# Altium schematic sheet TuringSMD.SchDoc
size A2; SheetNumber: 1; SheetTotal: 3
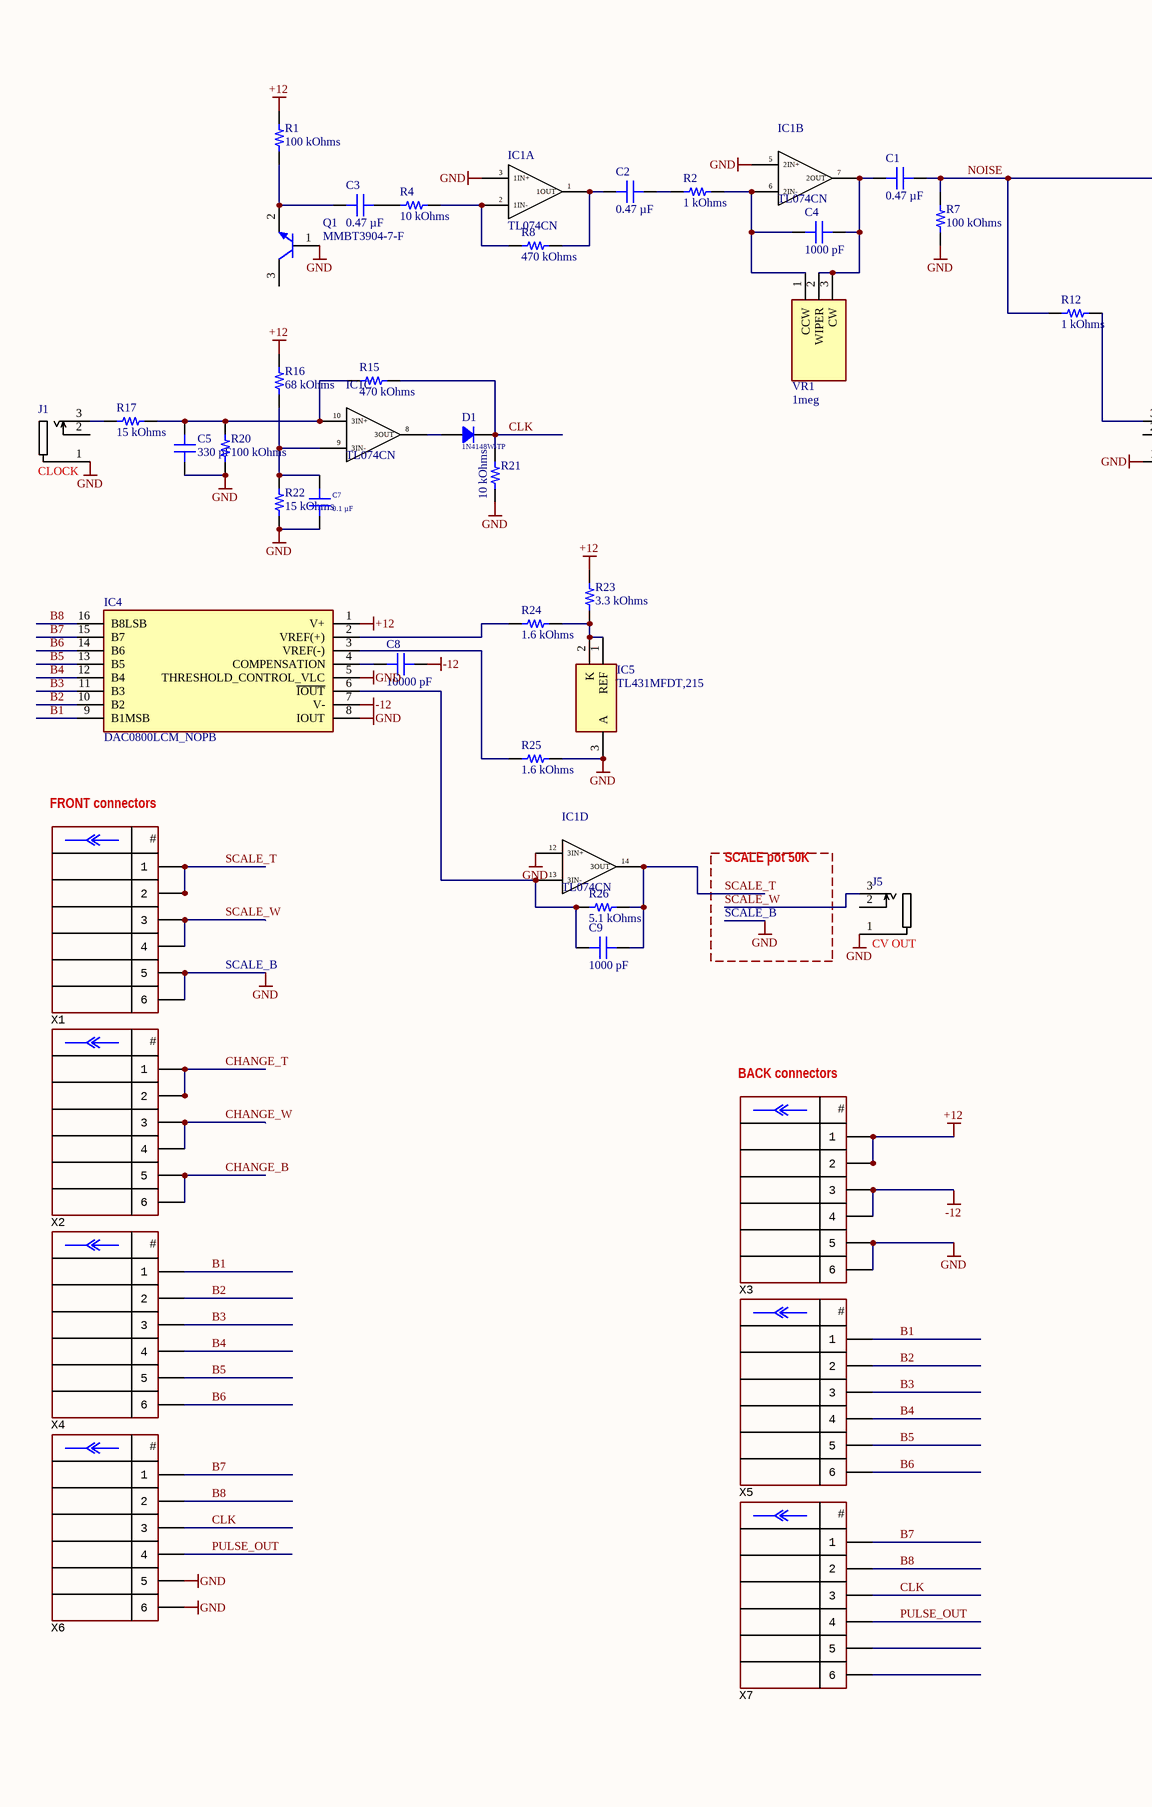
[diagram p0: TuringSMD.SchDoc, left]
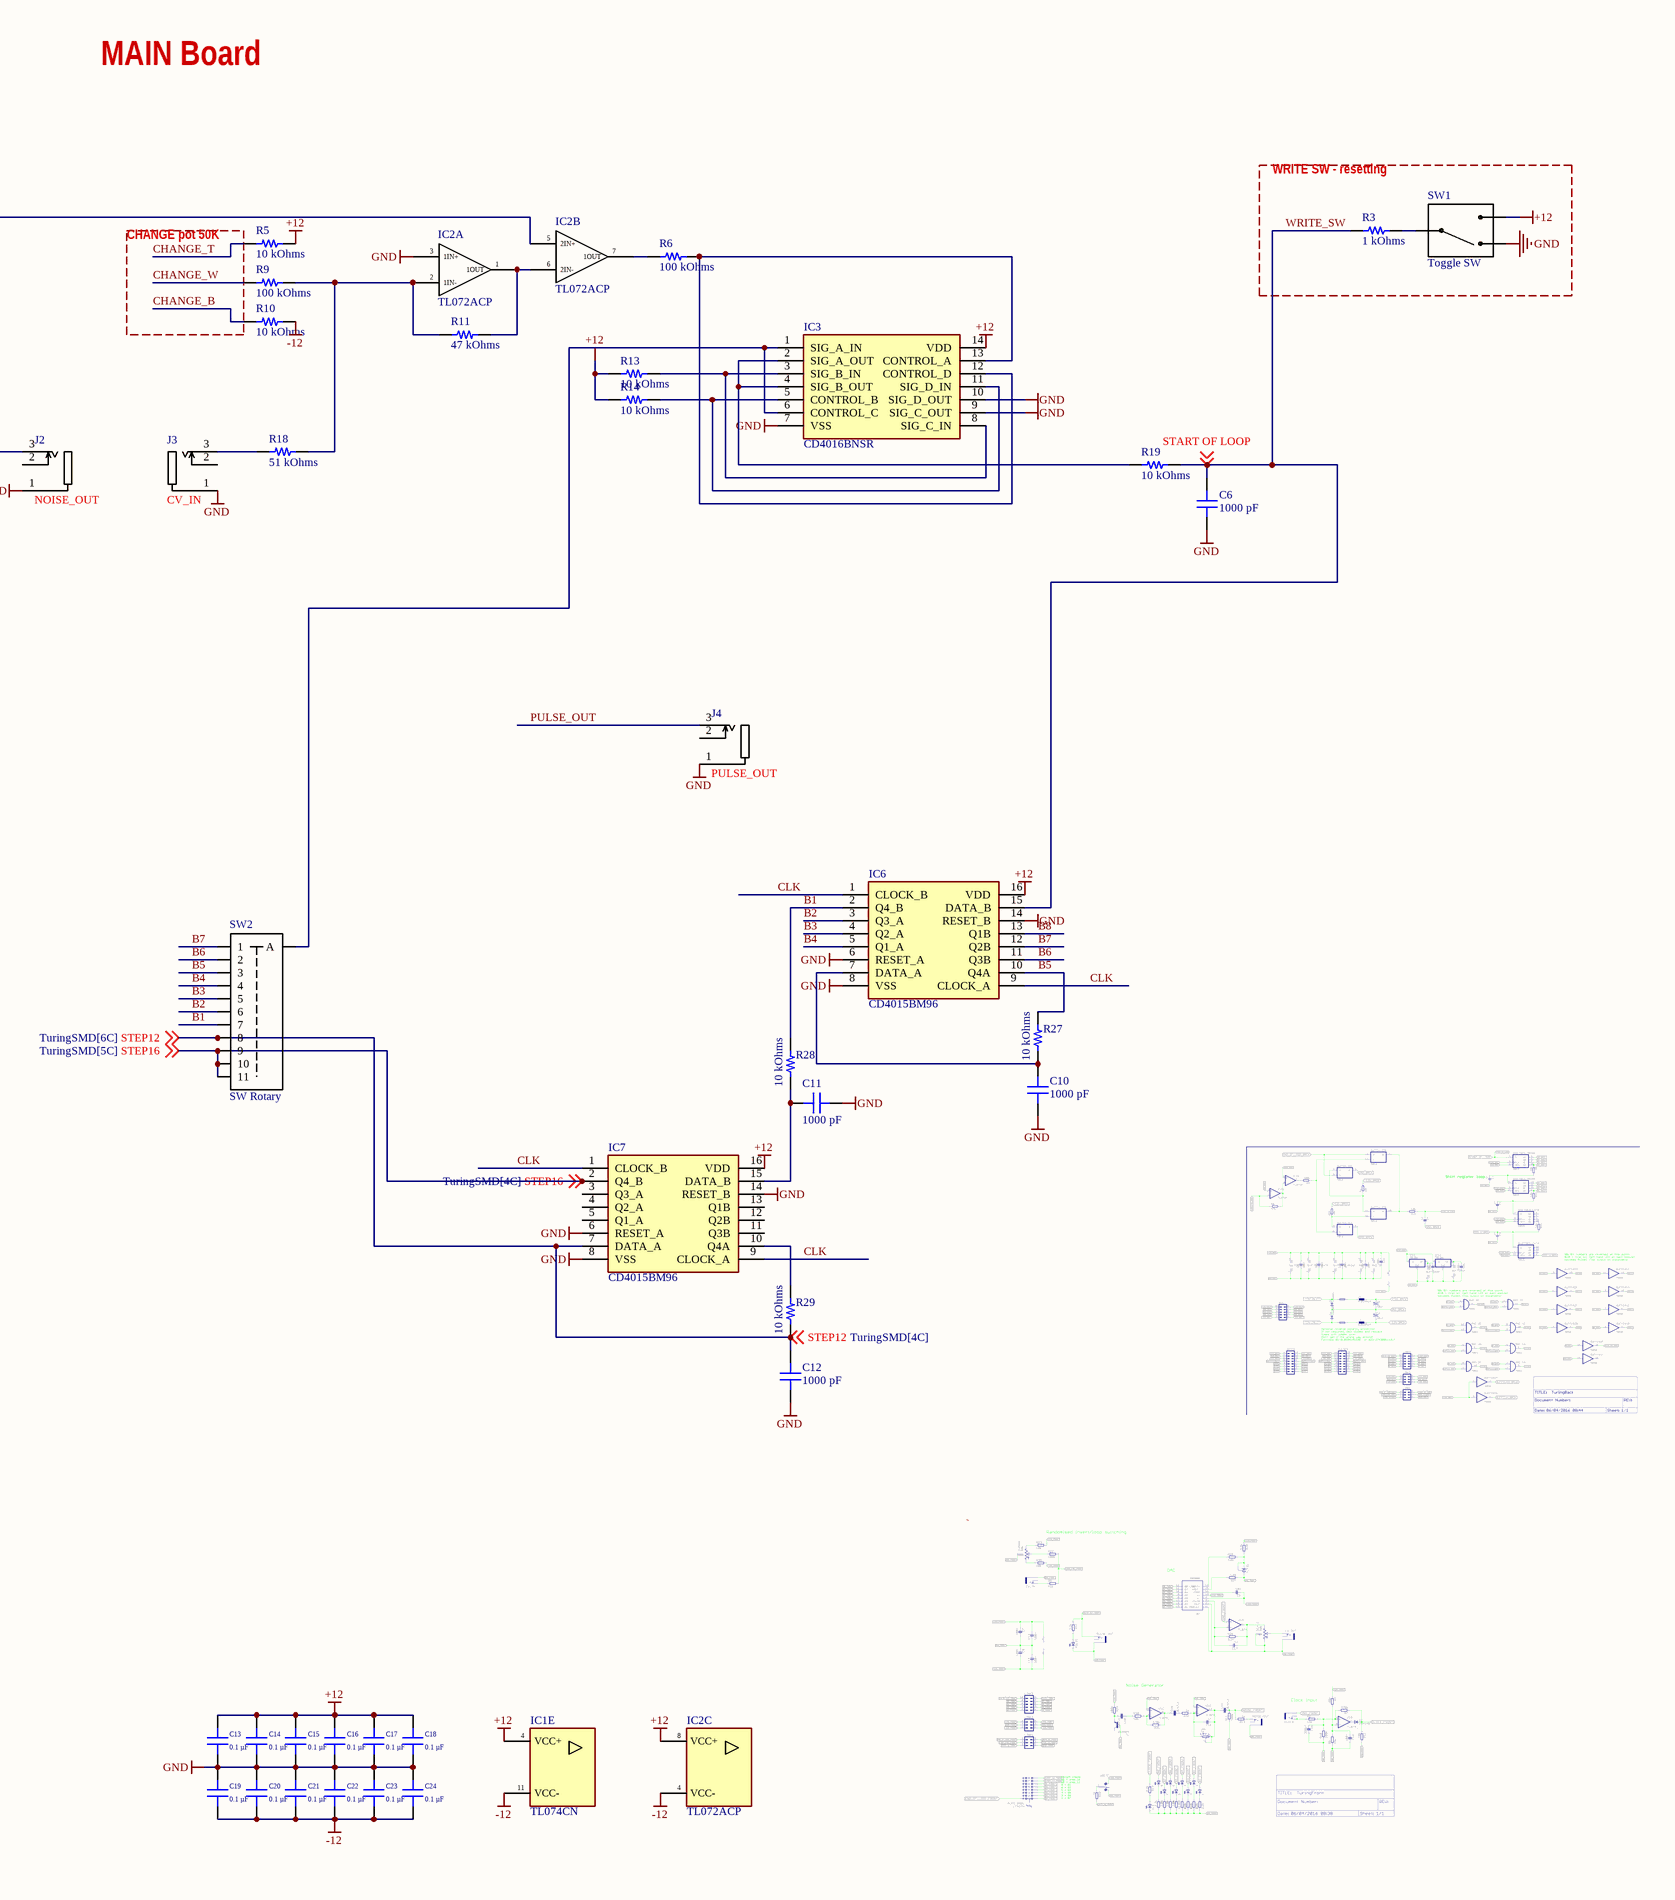
[diagram p1: TuringSMD.SchDoc, right]

## Parts
C1  0.47 µF  [CAP FILM 1206]
C2  0.47 µF  [CAP FILM 1206]
C3  0.47 µF  [CAP FILM 1206]
C4  1000 pF  [CAP 0603_1608]
C5  330 pF  [CAP 0603_1608]
C6  1000 pF  [CAP 0603_1608]
C7  0.1 µF  [CAP 0603_1608]
C8  10000 pF  [CAP 0603_1608]
C9  1000 pF  [CAP 0603_1608]
C10  1000 pF  [CAP 0603_1608]
C11  1000 pF  [CAP 0603_1608]
C12  1000 pF  [CAP 0603_1608]
C13  0.1 µF  [CAP 0603_1608]
C14  0.1 µF  [CAP 0603_1608]
C15  0.1 µF  [CAP 0603_1608]
C16  0.1 µF  [CAP 0603_1608]
C17  0.1 µF  [CAP 0603_1608]
C18  0.1 µF  [CAP 0603_1608]
C19  0.1 µF  [CAP 0603_1608]
C20  0.1 µF  [CAP 0603_1608]
C21  0.1 µF  [CAP 0603_1608]
C22  0.1 µF  [CAP 0603_1608]
C23  0.1 µF  [CAP 0603_1608]
C24  0.1 µF  [CAP 0603_1608]
D1  1N4148W-TP  [SOD-123]
IC1  TL074CN  [DIP794W53P254L1930H508Q14N]  (parts A,B,C,D,E of 5)
IC2  TL072ACP  [SOIC-8]  (parts A,B,C of 3)
IC3  CD4016BNSR  [SOIC127P780X200-14N]
IC4  DAC0800LCM_NOPB  [SOIC127P600X175-16N]
IC5  TL431MFDT,215  [SOT95P230X110-3N]
IC6  CD4015BM96  [SOIC127P600X175-16N]
IC7  CD4015BM96  [SOIC127P600X175-16N]
J1  CLOCK  [THONKICONN]
J2  NOISE_OUT  [THONKICONN]
J3  CV_IN  [THONKICONN]
J4  PULSE_OUT  [THONKICONN]
J5  CV OUT  [THONKICONN]
Q1  MMBT3904-7-F  [DIODES SOT-23-3]
R1  100 kOhms  [YAGEO RES 0603_1608]
R2  1 kOhms  [YAGEO RES 0603_1608]
R3  1 kOhms  [YAGEO RES 0603_1608]
R4  10 kOhms  [YAGEO RES 0603_1608]
R5  10 kOhms  [YAGEO RES 0603_1608]
R6  100 kOhms  [YAGEO RES 0603_1608]
R7  100 kOhms  [YAGEO RES 0603_1608]
R8  470 kOhms  [YAGEO RES 0603_1608]
R9  100 kOhms  [YAGEO RES 0603_1608]
R10  10 kOhms  [YAGEO RES 0603_1608]
R11  47 kOhms  [YAGEO RES 0603_1608]
R12  1 kOhms  [YAGEO RES 0603_1608]
R13  10 kOhms  [YAGEO RES 0603_1608]
R14  10 kOhms  [YAGEO RES 0603_1608]
R15  470 kOhms  [YAGEO RES 0603_1608]
R16  68 kOhms  [YAGEO RES 0603_1608]
R17  15 kOhms  [YAGEO RES 0603_1608]
R18  51 kOhms  [YAGEO RES 0603_1608]
R19  10 kOhms  [YAGEO RES 0603_1608]
R20  100 kOhms  [YAGEO RES 0603_1608]
R21  10 kOhms  [YAGEO RES 0603_1608]
R22  15 kOhms  [YAGEO RES 0603_1608]
R23  3.3 kOhms  [YAGEO RES 0603_1608]
R24  1.6 kOhms  [YAGEO RES 0603_1608]
R25  1.6 kOhms  [YAGEO RES 0603_1608]
R26  5.1 kOhms  [YAGEO RES 0603_1608]
R27  10 kOhms  [YAGEO RES 0603_1608]
R28  10 kOhms  [YAGEO RES 0603_1608]
R29  10 kOhms  [YAGEO RES 0603_1608]
SW1  Toggle SW  [TOGGLE SW]
SW2  SW Rotary  [SW_ROTARY]
VR1  1meg  [3296X1223LF]
X1  (no value)  [CON: PBD-6]
X2  (no value)  [CON: PBD-6]
X3  (no value)  [CON: PBD-6]
X4  (no value)  [CON: PBD-6]
X5  (no value)  [CON: PBD-6]
X6  (no value)  [CON: PBD-6]
X7  (no value)  [CON: PBD-6]

## Blocks framed on the sheet
WRITE SW - resetting: R3 SW1

## Nets
+12: C13.2 C14.2 C15.2 C16.2 C17.2 C18.2 IC1.4(VCC+) IC2.8(VCC+) IC3.14(VDD) IC4.1(V+) IC6.16(VDD) IC7.16(VDD) R1.2 R5.1 R13.2 R14.2 R16.2 R23.2 SW1.3 X3.1 X3.2
-12: C8.1 C19.1 C20.1 C21.1 C22.1 C23.1 C24.1 IC1.11(VCC-) IC2.4(VCC-) IC4.7(V-) R10.1 X3.3 X3.4
GND: C5.1 C6.1 C7.1 C10.1 C11.1 C12.1 C13.1 C14.1 C15.1 C16.1 C17.1 C18.1 C19.2 C20.2 C21.2 C22.2 C23.2 C24.2 IC1.3(1IN+) IC1.5(2IN+) IC1.12(3IN+) IC2.3(1IN+) IC3.7(VSS) IC3.9(SIG_C_OUT) IC3.10(SIG_D_OUT) IC4.5(THRESHOLD_CONTROL_VLC) IC4.8(IOUT) IC5.3(A) IC6.6(RESET_A) IC6.8(VSS) IC6.14(RESET_B) IC7.6(RESET_A) IC7.8(VSS) IC7.14(RESET_B) J1.1 J2.1 J3.1 J4.1 J5.1 Q1.1(B) R7.2 R20.1 R21.1 R22.1 R25.2 SW1.1 X1.5 X1.6 X3.5 X3.6 X6.5 X6.6
B1: IC4.9(B1MSB) IC6.2(Q4_B) R28.2 SW2.7 X4.1 X5.1
B2: IC4.10(B2) IC6.3(Q3_A) SW2.6 X4.2 X5.2
B3: IC4.11(B3) IC6.4(Q2_A) SW2.5 X4.3 X5.3
B4: IC4.12(B4) IC6.5(Q1_A) SW2.4 X4.4 X5.4
B5: IC4.13(B5) IC6.10(Q4A) R27.2 SW2.3 X4.5 X5.5
B6: IC4.14(B6) IC6.11(Q3B) SW2.2 X4.6 X5.6
B7: IC4.15(B7) IC6.12(Q2B) SW2.1 X6.1 X7.1
B8: IC4.16(B8LSB) IC6.13(Q1B) X6.2 X7.2
CHANGE_B: R10.2 X2.5 X2.6
CHANGE_T: R5.2 X2.1 X2.2
CHANGE_W: R9.1 X2.3 X2.4
CLK: D1.2 IC6.1(CLOCK_B) IC6.9(CLOCK_A) IC7.1(CLOCK_B) IC7.9(CLOCK_A) R15.2 R21.2 X6.3 X7.3
NOISE: C1.2 IC2.5(2IN+) R7.1 R12.2
PULSE_OUT: J4.3 X6.4 X7.4
SCALE_T: C9.2 IC1.14(3OUT) R26.2 X1.1 X1.2
SCALE_W: J5.3 X1.3 X1.4
STEP12: C12.2 IC7.7(DATA_A) R29.1 SW2.8 ; off-sheet STEP12
STEP16: IC7.2(Q4_B) SW2.9 SW2.10 SW2.11 ; off-sheet STEP16
WRITE_SW: C6.2 IC6.15(DATA_B) R3.1 R19.1 ; off-sheet START OF LOOP  [also labelled START OF LOOP]
NetC1_1: C1.1 C4.2 IC1.7(2OUT) VR1.2(WIPER) VR1.3(CW)
NetC2_1: C2.1 IC1.1(1OUT) R8.2
NetC2_2: C2.2 R2.2
NetC3_1: C3.1 Q1.2(E) R1.1
NetC3_2: C3.2 R4.2
NetC4_1: C4.1 IC1.6(2IN-) R2.1 VR1.1(CCW)
NetC5_2: C5.2 IC1.10(3IN+) R15.1 R17.1 R20.2
NetC7_2: C7.2 IC1.9(3IN-) R16.1 R22.2
NetC8_2: C8.2 IC4.4(COMPENSATION)
NetC9_1: C9.1 IC1.13(3IN-) IC4.6(~{IOUT}) R26.1
NetC10_2: C10.2 IC6.7(DATA_A) R27.1
NetC11_2: C11.2 IC7.15(DATA_B) R28.1
NetD1_1: D1.1 IC1.8(3OUT)
NetIC1_2: IC1.2(1IN-) R4.1 R8.1
NetIC2_1: IC2.1(1OUT) IC2.6(2IN-) R11.2
NetIC2_2: IC2.2(1IN-) R9.2 R11.1 R18.2
NetIC2_7: IC2.7(1OUT) R6.1
NetIC3_1: IC3.1(SIG_A_IN) IC3.6(CONTROL_C) SW2.A
NetIC3_2: IC3.2(SIG_A_OUT) IC3.4(SIG_B_OUT) R19.2
NetIC3_3: IC3.3(SIG_B_IN) IC3.8(SIG_C_IN) R13.1
NetIC3_5: IC3.5(CONTROL_B) IC3.11(SIG_D_IN) R14.1
NetIC3_12: IC3.12(CONTROL_D) IC3.13(CONTROL_A) R6.2
NetIC4_2: IC4.2(VREF(+)) R24.1
NetIC4_3: IC4.3(VREF(-)) R25.1
NetIC5_1: IC5.1(REF) IC5.2(K) R23.1 R24.2
NetIC7_10: IC7.10(Q4A) R29.2
NetJ1_3: J1.3 R17.2
NetJ2_3: J2.3 R12.1
NetJ3_3: J3.3 R18.1
NetR3_2: R3.2 SW1.2

Not connected (* = marked no-connect by the designer): IC7 3(Q3_A) 4(Q2_A) 5(Q1_A) 11(Q3B) 12(Q2B) 13(Q1B); J1 2(4); J2 2(4); J3 2(4); J4 2(4); J5 2(4); Q1 3(C); X7 5 6

## Notes on the sheet
- MAIN Board
- CHANGE pot 50K
- FRONT connectors
- SCALE pot 50K
- SCALE_B
- BACK connectors
- (in symbol PBD-6) #

## Library data of the parts
C1-C3 = ECP-U1C474MA5: CAP FILM 0.47UF 20% 16VDC 1206; Manufacturer: Panasonic Electronic Components; Dielectric Material: Acrylic, Metallized - Stacked; Voltage Rating - AC: 12V; Voltage Rating - DC: 16V; Part Number: ECP-U1C474MA5; Capacitance: 0.47 µF; Applications: EMI, RFI Suppression; ComponentLink1Description: Datasheet; ComponentLink1URL: http://industrial.panasonic.com/www-cgi/jvcr13pz.cgi?E+PZ+3+ABD0012+ECPU1C474MA5+7+WW; ComponentLink2Description: DigiKey Link; ComponentLink2URL: https://www.digikey.com/en/products/detail/panasonic-electronic-components/ECP-U1C474MA5/285450; Device Package: 1206 (3216 Metric); Features: Low ESR; Height - Seated (Max): 0.063" (1.60mm); LastUpdated: 6/3/2024 8:14:42 PM; Lifecycle Status: Active; Minimum Order: 1; Mounting Type: Surface Mount; Operating Temperature: -40°C ~ 85°C; Package / Case: 1206 (3216 Metric); Packaging: TapeAndReel; Part Status: Active; Price: 0.22; Series: ECP-U(A); Size / Dimension: 0.126" L x 0.063" W (3.20mm x 1.60mm); Supplier 1: DigiKey; Supplier Part Number 1: PCF1130CT-ND; Termination: Solder Pads; Tolerance: ±20%; Value: 0.47 µF
C4 C6 C9-C12 = C1608X8R1H102K080AA: CAP CER 1000PF 50V X8R 0603; manufacturer: TDK Corporation; Tolerance: ±10%; Part Number: C1608X8R1H102K080AA; Capacitance: 1000 pF; Applications: General Purpose; componentlink1description: Datasheet; componentlink1url: https://product.tdk.com/info/en/catalog/datasheets/mlcc_commercial_hightemp_en.pdf?ref_disty=digikey; componentlink2description: DigiKey Link; componentlink2url: https://www.digikey.com/en/products/detail/tdk-corporation/C1608X8R1H102K080AA/927127; Device Package: 0603 (1608 Metric); Features: High Temperature; lastupdated: 2/9/2024 8:10:30 PM; Lifecycle Status: Active; Minimum Order: 1; Mounting Type: Surface Mount, MLCC; Operating Temperature: -55°C ~ 150°C; Package / Case: 0603 (1608 Metric); packaging: TapeAndReel; partid: 2708; Part Status: Active; price: 0.01; series: C; Size / Dimension: 0.063" L x 0.031" W (1.60mm x 0.80mm); Supplier 1: DigiKey; Supplier Part Number 1: 445-2501-1-ND; Temperature Coefficient: X8R; Thickness (Max): 0.035" (0.90mm); value: 1000 pF; Voltage - Rated: 50V
C5 = AC0603JRNPO9BN331: CAP CER 330PF 50V C0G/NPO 0603; manufacturer: Yageo; Temperature Coefficient: C0G, NP0; Tolerance: ±5%; Part Number: AC0603JRNPO9BN331; Capacitance: 330 pF; Applications: Automotive; componentlink1description: Datasheet; componentlink1url: http://www.yageo.com/NewPortal/_en/search/productDocs.jsp?YageoPartNumber=AC0603JRNPO9BN331; componentlink2description: DigiKey Link; componentlink2url: https://www.digikey.com/en/products/detail/yageo/AC0603JRNPO9BN331/6643266; Device Package: 0603 (1608 Metric); lastupdated: 2/9/2024 8:10:30 PM; Lifecycle Status: Active; Minimum Order: 1; Mounting Type: Surface Mount, MLCC; Operating Temperature: -55°C ~ 125°C; Package / Case: 0603 (1608 Metric); packaging: TapeAndReel; partid: 2321; Part Status: Active; price: 0.01; Ratings: AEC-Q200; series: AC; Size / Dimension: 0.063" L x 0.031" W (1.60mm x 0.80mm); Supplier 1: DigiKey; Supplier Part Number 1: 311-3280-1-ND; Thickness (Max): 0.035" (0.90mm); value: 330 pF; Voltage - Rated: 50V
C7 C13-C24 = C0603C104K5RAC7411: CAP CER 0.1UF 50V X7R 0603; manufacturer: KEMET; Tolerance: ±10%; Part Number: C0603C104K5RAC7411; Value: 0.1 µF; Applications: Bypass, Decoupling; Capacitance: 0.1 µF; componentlink1description: Datasheet; componentlink1url: https://api.kemet.com/component-edge/download/datasheet/C0603C104K5RAC7411.pdf; componentlink2description: DigiKey Link; componentlink2url: https://www.digikey.com/en/products/detail/kemet/C0603C104K5RAC7411/3317013; Device Package: 0603 (1608 Metric); lastupdated: 2/9/2024 8:10:30 PM; Lifecycle Status: Active; Minimum Order: 1; Mounting Type: Surface Mount, MLCC; Operating Temperature: -55°C ~ 125°C; Package / Case: 0603 (1608 Metric); packaging: TapeAndReel; partid: 2233; Part Status: Active; price: 0.01; series: SMD Comm X7R; Size / Dimension: 0.063" L x 0.031" W (1.60mm x 0.80mm); Supplier 1: DigiKey; Supplier Part Number 1: 399-C0603C104K5RAC7411CT-ND; Temperature Coefficient: X7R; Thickness (Max): 0.035" (0.90mm); Voltage - Rated: 50V
C8 = CGA3E2X8R1H103K080AA: CAP CER 10000PF 50V X8R 0603; manufacturer: TDK Corporation; Tolerance: ±10%; Part Number: CGA3E2X8R1H103K080AA; Capacitance: 10000 pF; Applications: Automotive; componentlink1description: Datasheet; componentlink1url: https://product.tdk.com/info/en/catalog/datasheets/mlcc_automotive_hightemp_en.pdf?ref_disty=digikey; componentlink2description: DigiKey Link; componentlink2url: https://www.digikey.com/en/products/detail/tdk-corporation/CGA3E2X8R1H103K080AA/2443370; Device Package: 0603 (1608 Metric); Features: High Temperature; lastupdated: 2/9/2024 8:10:29 PM; Lifecycle Status: Active; Minimum Order: 1; Mounting Type: Surface Mount, MLCC; Operating Temperature: -55°C ~ 150°C; Package / Case: 0603 (1608 Metric); packaging: TapeAndReel; partid: 2732; Part Status: Active; price: 0.01; Ratings: AEC-Q200; series: CGA; Size / Dimension: 0.063" L x 0.031" W (1.60mm x 0.80mm); Supplier 1: DigiKey; Supplier Part Number 1: 445-5892-1-ND; Temperature Coefficient: X8R; Thickness (Max): 0.035" (0.90mm); value: 10000 pF; Voltage - Rated: 50V
D1 = 1N4148W-TP: DIODE GEN PURP 100V 150MA SOD123; Manufacturer: Micro Commercial Co; Capacitance @ Vr, F: 2pF @ 0V, 1MHz; Current - Reverse Leakage @ Vr: 1 µA @ 75 V; Diode Type: Standard; Reverse Recovery Time (trr): 4 ns; Speed: Small Signal =< 200mA (Io), Any Speed; Voltage - Forward (Vf) (Max) @ If: 1.25 V @ 150 mA; Part Number: 1N4148W-TP; ComponentLink1Description: Datasheet; ComponentLink1URL: https://www.mccsemi.com/pdf/Products/1N4148W(SOD123).pdf; ComponentLink2Description: DigiKey Link; ComponentLink2URL: https://www.digikey.com/en/products/detail/micro-commercial-co/1N4148W-TP/717196; Current - Average Rectified (Io): 150mA; LastUpdated: 6/3/2024 7:54:46 PM; Lifecycle Status: Active; Minimum Order: 1; Mounting Type: Surface Mount; Operating Temperature - Junction: -65°C ~ 150°C; Package / Case: SOD-123; Packaging: TapeAndReel; PartId: 999; Part Status: Active; Price: 0.01; Series: -; Supplier 1: DigiKey; Supplier Part Number 1: 1N4148WTPMSCT-ND; Supplier Device Package: SOD-123; Voltage - DC Reverse (Vr) (Max): 100 V
IC1 = TL074CN: Integrated Circuit; Manufacturer_Name: Texas Instruments; Datasheet Link: https://www.ti.com/lit/ds/symlink/tl074.pdf?HQS=TI-null-null-mousermode-df-pf-null-wwe&ts=1598513500878&ref_url=https%253A%252F%252Feu.mouser.com%252F; Height: 5.08mm; Manufacturer_Part_Number: TL074CN; Mouser Part Number: 595-TL074CN; Mouser Price/Stock: https://www.mouser.co.uk/ProductDetail/Texas-Instruments/TL074CN?qs=AMJt07B76uv7dLYnj7iLiQ%3D%3D; Arrow Part Number: TL074CN; Arrow Price/Stock: https://www.arrow.com/en/products/tl074cn/texas-instruments?utm_currency=USD&region=nac
IC2 = TL072ACP: Integrated Circuit; Manufacturer_Name: Texas Instruments; Datasheet Link: http://www.ti.com/lit/ds/symlink/tl071a.pdf; Height: 5.08mm; Manufacturer_Part_Number: TL072ACP; Mouser Part Number: 595-TL072ACP; Mouser Price/Stock: https://www.mouser.co.uk/ProductDetail/Texas-Instruments/TL072ACP?qs=0OT4q4QBUTLFvIZ%252B%2FvrwoQ%3D%3D; Arrow Part Number: TL072ACP; Arrow Price/Stock: https://www.arrow.com/en/products/tl072acp/texas-instruments?utm_currency=USD&region=europe
IC3 = CD4016BNSR: Integrated Circuit; Manufacturer_Name: Texas Instruments; Datasheet Link: https://www.ti.com/lit/ds/symlink/cd4016b.pdf?ts=1617176409786&ref_url=https%253A%252F%252Fwww.ti.com%252Fstore%252Fti%252Fen%252Fp%252Fproduct%252F%253Fp%253DCD4016BNSR%2526keyMatch%253DCD4016BNSR%2526tisearch%253Dsearch-everything%2526usecase%253DOPN; Height: 2mm; Manufacturer_Part_Number: CD4016BNSR; Mouser Part Number: 595-CD4016BNSR; Mouser Price/Stock: https://www.mouser.co.uk/ProductDetail/Texas-Instruments/CD4016BNSR?qs=DXdcjUGny5PNUtZB%252BpoaOA%3D%3D; Arrow Part Number: CD4016BNSR; Arrow Price/Stock: https://www.arrow.com/en/products/cd4016bnsr/texas-instruments?utm_currency=USD&region=nac
IC4 = DAC0800LCM_NOPB: Integrated Circuit; Manufacturer_Name: Texas Instruments; Manufacturer_Part_Number: DAC0800LCM/NOPB; Datasheet Link: http://www.ti.com/lit/ds/symlink/dac0800.pdf; Height: 1.75mm; Mouser Part Number: 926-DAC0800LCM/NOPB; Mouser Price/Stock: https://www.mouser.co.uk/ProductDetail/Texas-Instruments/DAC0800LCM-NOPB?qs=7X5t%252BdzoRHB3UMLDAB6Vww%3D%3D; Arrow Part Number: DAC0800LCM/NOPB; Arrow Price/Stock: https://www.arrow.com/en/products/dac0800lcmnopb/texas-instruments?utm_currency=USD&region=europe
IC5 = TL431MFDT,215: Integrated Circuit; Manufacturer_Name: Nexperia; Datasheet Link: https://assets.nexperia.com/documents/data-sheet/TL431_FAM.pdf; Height: 1.1mm; Manufacturer_Part_Number: TL431MFDT,215; Mouser Part Number: 771-TL431MFDT215; Mouser Price/Stock: https://www.mouser.co.uk/ProductDetail/Nexperia/TL431MFDT215?qs=A1cBxND5mHKvFzVl3lBdcQ%3D%3D; Arrow Part Number: TL431MFDT,215; Arrow Price/Stock: https://www.arrow.com/en/products/tl431mfdt215/nexperia?utm_currency=USD&region=nac
IC6 IC7 = CD4015BM96: Integrated Circuit; Manufacturer_Name: Texas Instruments; Datasheet Link: http://www.ti.com/general/docs/lit/getliterature.tsp?genericPartNumber=CD4015B&&fileType=pdf; Height: 1.75mm; Manufacturer_Part_Number: CD4015BM96; Mouser Part Number: 595-CD4015BM96; Mouser Price/Stock: https://www.mouser.co.uk/ProductDetail/Texas-Instruments/CD4015BM96?qs=vmM6vcLFxxH3zP0zlXu8Qg%3D%3D; Arrow Part Number: CD4015BM96; Arrow Price/Stock: https://www.arrow.com/en/products/cd4015bm96/texas-instruments?region=nac
J1-J5 = PJ-301M-3P: THONKICONN metal
Q1 = MMBT3904-7-F: TRANS NPN 40V 0.2A SOT23-3; Manufacturer: Diodes Incorporated; Current - Collector Cutoff (Max): 50nA (ICBO); Current - Collector (Ic) (Max): 200 mA; DC Current Gain (hFE) (Min) @ Ic, Vce: 100 @ 10mA, 1V; Frequency - Transition: 300MHz; Power - Max: 300 mW; Vce Saturation (Max) @ Ib, Ic: 300mV @ 5mA, 50mA; Part Number: MMBT3904-7-F; ComponentLink1Description: Datasheet; ComponentLink1URL: https://www.diodes.com/assets/Datasheets/ds30036.pdf; ComponentLink2Description: DigiKey Link; ComponentLink2URL: https://www.digikey.com/en/products/detail/diodes-incorporated/MMBT3904-7-F/814494; LastUpdated: 6/3/2024 8:24:11 PM; Lifecycle Status: Active; Minimum Order: 1; Mounting Type: Surface Mount; Operating Temperature: -55°C ~ 150°C (TJ); Package / Case: TO-236-3, SC-59, SOT-23-3; Packaging: TapeAndReel; PartId: 85; Part Status: Active; Price: 0.01; Series: -; Supplier 1: DigiKey; Supplier Part Number 1: MMBT3904-FDICT-ND; Supplier Device Package: SOT-23-3; Transistor Type: NPN; Voltage - Collector Emitter Breakdown (Max): 40 V
R1 R6 R7 R9 R20 = AA0603FR-07100KL: RES SMD 100K OHM 1% 1/10W 0603; Manufacturer: Yageo; Power (Watts): 0.1W, 1/10W; Temperature Coefficient: ±150ppm/°C; Part Number: AA0603FR-07100KL; Value: 100 kOhms; ComponentLink1Description: Datasheet; ComponentLink1URL: https://www.yageo.com/upload/media/product/productsearch/datasheet/rchip/PYu-AA_51_RoHS_L_3.pdf; ComponentLink2Description: DigiKey Link; ComponentLink2URL: https://www.digikey.com/en/products/detail/yageo/AA0603FR-07100KL/5888687; Composition: Thick Film; Device Package: 0603 (1608 Metric); Features: Anti-Sulfur, Automotive AEC-Q200, Moisture Resistant; Height - Seated (Max): 0.022" (0.55mm); LastUpdated: 7/25/2024 9:19:03 AM; Lifecycle Status: Active; Minimum Order: 1; Number of Terminations: 2; Operating Temperature: -55°C ~ 155°C; Package / Case: 0603 (1608 Metric); Packaging: TapeAndReel; PartId: 78895; Price: 0.01; Ratings: AEC-Q200; Resistance: 100 kOhms; Series: AA; Size / Dimension: 0.063" L x 0.031" W (1.60mm x 0.80mm); Supplier 1: DigiKey; Supplier Part Number 1: 13-AA0603FR-07100KLCT-ND; Supplier Device Package: 0603; Tolerance: ±1%
R2 R3 R12 = AA0603FR-071KL: RES SMD 1K OHM 1% 1/10W 0603; Manufacturer: Yageo; Power (Watts): 0.1W, 1/10W; Temperature Coefficient: ±150ppm/°C; Part Number: AA0603FR-071KL; Value: 1 kOhms; ComponentLink1Description: Datasheet; ComponentLink1URL: https://www.yageo.com/upload/media/product/productsearch/datasheet/rchip/PYu-AA_51_RoHS_L_3.pdf; ComponentLink2Description: DigiKey Link; ComponentLink2URL: https://www.digikey.com/en/products/detail/yageo/AA0603FR-071KL/5888847; Composition: Thick Film; Device Package: 0603 (1608 Metric); Features: Anti-Sulfur, Automotive AEC-Q200, Moisture Resistant; Height - Seated (Max): 0.022" (0.55mm); LastUpdated: 7/25/2024 9:19:15 AM; Lifecycle Status: Active; Minimum Order: 1; Number of Terminations: 2; Operating Temperature: -55°C ~ 155°C; Package / Case: 0603 (1608 Metric); Packaging: TapeAndReel; PartId: 64335; Part Status: Active; Price: 0.01; Ratings: AEC-Q200; Resistance: 1 kOhms; Series: AA; Size / Dimension: 0.063" L x 0.031" W (1.60mm x 0.80mm); Supplier 1: DigiKey; Supplier Part Number 1: 13-AA0603FR-071KLCT-ND; Supplier Device Package: 0603; Tolerance: ±1%
R4 R5 R10 R13 R14 R19 R21 R27-R29 = AA0603FR-0710KL: RES SMD 10K OHM 1% 1/10W 0603; Manufacturer: Yageo; Power (Watts): 0.1W, 1/10W; Temperature Coefficient: ±150ppm/°C; Part Number: AA0603FR-0710KL; Value: 10 kOhms; ComponentLink1Description: Datasheet; ComponentLink1URL: https://www.yageo.com/upload/media/product/productsearch/datasheet/rchip/PYu-AA_51_RoHS_L_3.pdf; ComponentLink2Description: DigiKey Link; ComponentLink2URL: https://www.digikey.com/en/products/detail/yageo/AA0603FR-0710KL/5888698; Composition: Thick Film; Device Package: 0603 (1608 Metric); Features: Anti-Sulfur, Automotive AEC-Q200, Moisture Resistant; Height - Seated (Max): 0.022" (0.55mm); LastUpdated: 7/25/2024 9:19:15 AM; Lifecycle Status: Active; Minimum Order: 1; Number of Terminations: 2; Operating Temperature: -55°C ~ 155°C; Package / Case: 0603 (1608 Metric); Packaging: TapeAndReel; PartId: 64302; Part Status: Active; Price: 0.01; Ratings: AEC-Q200; Resistance: 10 kOhms; Series: AA; Size / Dimension: 0.063" L x 0.031" W (1.60mm x 0.80mm); Supplier 1: DigiKey; Supplier Part Number 1: 13-AA0603FR-0710KLCT-ND; Supplier Device Package: 0603; Tolerance: ±1%
R8 R15 = AC0603FR-07470KL: RES SMD 470K OHM 1% 1/10W 0603; Manufacturer: Yageo; Power (Watts): 0.1W, 1/10W; Temperature Coefficient: ±100ppm/°C; Part Number: AC0603FR-07470KL; Value: 470 kOhms; ComponentLink1Description: Datasheet; ComponentLink1URL: https://www.yageo.com/upload/media/product/productsearch/datasheet/rchip/PYu-AC_51_RoHS_L_7.pdf; ComponentLink2Description: DigiKey Link; ComponentLink2URL: https://www.digikey.com/en/products/detail/yageo/AC0603FR-07470KL/5896138; Composition: Thick Film; Device Package: 0603 (1608 Metric); Features: Automotive AEC-Q200, Moisture Resistant; Height - Seated (Max): 0.022" (0.55mm); LastUpdated: 7/25/2024 9:19:25 AM; Lifecycle Status: Active; Minimum Order: 1; Number of Terminations: 2; Operating Temperature: -55°C ~ 155°C; Package / Case: 0603 (1608 Metric); Packaging: CutTape; PartId: 15826; Part Status: Active; Price: 0.01; Ratings: AEC-Q200; Resistance: 470 kOhms; Series: AC; Size / Dimension: 0.063" L x 0.031" W (1.60mm x 0.80mm); Supplier 1: DigiKey; Supplier Part Number 1: YAG3609CT-ND; Supplier Device Package: 0603; Tolerance: ±1%
R11 = AC0603FR-0747KL: RES SMD 47K OHM 1% 1/10W 0603; Manufacturer: Yageo; Power (Watts): 0.1W, 1/10W; Temperature Coefficient: ±100ppm/°C; Part Number: AC0603FR-0747KL; Value: 47 kOhms; ComponentLink1Description: Datasheet; ComponentLink1URL: https://www.yageo.com/upload/media/product/productsearch/datasheet/rchip/PYu-AC_51_RoHS_L_7.pdf; ComponentLink2Description: DigiKey Link; ComponentLink2URL: https://www.digikey.com/en/products/detail/yageo/AC0603FR-0747KL/5896142; Composition: Thick Film; Device Package: 0603 (1608 Metric); Features: Automotive AEC-Q200, Moisture Resistant; Height - Seated (Max): 0.022" (0.55mm); LastUpdated: 7/25/2024 9:19:23 AM; Lifecycle Status: Active; Minimum Order: 1; Number of Terminations: 2; Operating Temperature: -55°C ~ 155°C; Package / Case: 0603 (1608 Metric); Packaging: CutTape; PartId: 17391; Part Status: Active; Price: 0.01; Ratings: AEC-Q200; Resistance: 47 kOhms; Series: AC; Size / Dimension: 0.063" L x 0.031" W (1.60mm x 0.80mm); Supplier 1: DigiKey; Supplier Part Number 1: YAG3610CT-ND; Supplier Device Package: 0603; Tolerance: ±1%
R16 = AC0603FR-0768KL: RES SMD 68K OHM 1% 1/10W 0603; Manufacturer: Yageo; Power (Watts): 0.1W, 1/10W; Temperature Coefficient: ±100ppm/°C; Part Number: AC0603FR-0768KL; Value: 68 kOhms; ComponentLink1Description: Datasheet; ComponentLink1URL: https://www.yageo.com/upload/media/product/productsearch/datasheet/rchip/PYu-AC_51_RoHS_L_7.pdf; ComponentLink2Description: DigiKey Link; ComponentLink2URL: https://www.digikey.com/en/products/detail/yageo/AC0603FR-0768KL/5896252; Composition: Thick Film; Device Package: 0603 (1608 Metric); Features: Automotive AEC-Q200, Moisture Resistant; Height - Seated (Max): 0.022" (0.55mm); LastUpdated: 7/25/2024 9:19:23 AM; Lifecycle Status: Active; Minimum Order: 1; Number of Terminations: 2; Operating Temperature: -55°C ~ 155°C; Package / Case: 0603 (1608 Metric); Packaging: CutTape; PartId: 17378; Part Status: Active; Price: 0.01; Ratings: AEC-Q200; Resistance: 68 kOhms; Series: AC; Size / Dimension: 0.063" L x 0.031" W (1.60mm x 0.80mm); Supplier 1: DigiKey; Supplier Part Number 1: YAG3625CT-ND; Supplier Device Package: 0603; Tolerance: ±1%
R17 R22 = AA0603FR-0715KL: RES SMD 15K OHM 1% 1/10W 0603; Manufacturer: Yageo; Power (Watts): 0.1W, 1/10W; Temperature Coefficient: ±150ppm/°C; Part Number: AA0603FR-0715KL; Value: 15 kOhms; ComponentLink1Description: Datasheet; ComponentLink1URL: https://www.yageo.com/upload/media/product/app/datasheet/rchip/pyu-aa_51_rohs_l.pdf; ComponentLink2Description: DigiKey Link; ComponentLink2URL: https://www.digikey.com/en/products/detail/yageo/AA0603FR-0715KL/5888768; Composition: Thick Film; Device Package: 0603 (1608 Metric); Features: Anti-Sulfur, Automotive AEC-Q200, Moisture Resistant; Height - Seated (Max): 0.022" (0.55mm); LastUpdated: 7/25/2024 9:18:54 AM; Lifecycle Status: Active; Minimum Order: 1; Number of Terminations: 2; Operating Temperature: -55°C ~ 155°C; Package / Case: 0603 (1608 Metric); Packaging: TapeAndReel; PartId: 86832; Price: 0.01; Ratings: AEC-Q200; Resistance: 15 kOhms; Series: AA; Size / Dimension: 0.063" L x 0.031" W (1.60mm x 0.80mm); Supplier 1: DigiKey; Supplier Part Number 1: 13-AA0603FR-0715KLCT-ND; Supplier Device Package: 0603; Tolerance: ±1%
R18 = AC0603FR-0751KL: RES SMD 51K OHM 1% 1/10W 0603; Manufacturer: Yageo; Power (Watts): 0.1W, 1/10W; Temperature Coefficient: ±100ppm/°C; Part Number: AC0603FR-0751KL; Value: 51 kOhms; ComponentLink1Description: Datasheet; ComponentLink1URL: https://www.yageo.com/upload/media/product/productsearch/datasheet/rchip/PYu-AC_51_RoHS_L_7.pdf; ComponentLink2Description: DigiKey Link; ComponentLink2URL: https://www.digikey.com/en/products/detail/yageo/AC0603FR-0751KL/5896179; Composition: Thick Film; Device Package: 0603 (1608 Metric); Features: Automotive AEC-Q200, Moisture Resistant; Height - Seated (Max): 0.022" (0.55mm); LastUpdated: 7/25/2024 9:19:23 AM; Lifecycle Status: Active; Minimum Order: 1; Number of Terminations: 2; Operating Temperature: -55°C ~ 155°C; Package / Case: 0603 (1608 Metric); Packaging: CutTape; PartId: 17419; Part Status: Active; Price: 0.01; Ratings: AEC-Q200; Resistance: 51 kOhms; Series: AC; Size / Dimension: 0.063" L x 0.031" W (1.60mm x 0.80mm); Supplier 1: DigiKey; Supplier Part Number 1: YAG3616CT-ND; Supplier Device Package: 0603; Tolerance: ±1%
R23 = AC0603FR-073K3L: RES SMD 3.3K OHM 1% 1/10W 0603; Manufacturer: Yageo; Power (Watts): 0.1W, 1/10W; Temperature Coefficient: ±100ppm/°C; Part Number: AC0603FR-073K3L; Value: 3.3 kOhms; ComponentLink1Description: Datasheet; ComponentLink1URL: https://www.yageo.com/upload/media/product/productsearch/datasheet/rchip/PYu-AC_51_RoHS_L_7.pdf; ComponentLink2Description: DigiKey Link; ComponentLink2URL: https://www.digikey.com/en/products/detail/yageo/AC0603FR-073K3L/5896085; Composition: Thick Film; Device Package: 0603 (1608 Metric); Features: Automotive AEC-Q200, Moisture Resistant; Height - Seated (Max): 0.022" (0.55mm); LastUpdated: 7/25/2024 9:19:25 AM; Lifecycle Status: Active; Minimum Order: 1; Number of Terminations: 2; Operating Temperature: -55°C ~ 155°C; Package / Case: 0603 (1608 Metric); Packaging: CutTape; PartId: 16436; Part Status: Active; Price: 0.01; Ratings: AEC-Q200; Resistance: 3.3 kOhms; Series: AC; Size / Dimension: 0.063" L x 0.031" W (1.60mm x 0.80mm); Supplier 1: DigiKey; Supplier Part Number 1: YAG3605CT-ND; Supplier Device Package: 0603; Tolerance: ±1%
R24 R25 = AC0603FR-071K6L: RES SMD 1.6K OHM 1% 1/10W 0603; Manufacturer: Yageo; Power (Watts): 0.1W, 1/10W; Temperature Coefficient: ±100ppm/°C; Part Number: AC0603FR-071K6L; Value: 1.6 kOhms; ComponentLink1Description: Datasheet; ComponentLink1URL: https://www.yageo.com/upload/media/product/productsearch/datasheet/rchip/PYu-AC_51_RoHS_L_8.pdf; ComponentLink2Description: DigiKey Link; ComponentLink2URL: https://www.digikey.com/en/products/detail/yageo/AC0603FR-071K6L/5895870; Composition: Thick Film; Device Package: 0603 (1608 Metric); Features: Automotive AEC-Q200, Moisture Resistant; Height - Seated (Max): 0.022" (0.55mm); LastUpdated: 7/25/2024 9:19:12 AM; Lifecycle Status: Active; Minimum Order: 1; Number of Terminations: 2; Operating Temperature: -55°C ~ 155°C; Package / Case: 0603 (1608 Metric); Packaging: CutTape; PartId: 62199; Part Status: Active; Price: 0.01; Ratings: AEC-Q200; Resistance: 1.6 kOhms; Series: AC; Size / Dimension: 0.063" L x 0.031" W (1.60mm x 0.80mm); Supplier 1: DigiKey; Supplier Part Number 1: 13-AC0603FR-071K6LCT-ND; Supplier Device Package: 0603; Tolerance: ±1%
R26 = AC0603FR-075K1L: RES SMD 5.1K OHM 1% 1/10W 0603; Manufacturer: Yageo; Power (Watts): 0.1W, 1/10W; Temperature Coefficient: ±100ppm/°C; Part Number: AC0603FR-075K1L; Value: 5.1 kOhms; ComponentLink1Description: Datasheet; ComponentLink1URL: https://www.yageo.com/upload/media/product/productsearch/datasheet/rchip/PYu-AC_51_RoHS_L_7.pdf; ComponentLink2Description: DigiKey Link; ComponentLink2URL: https://www.digikey.com/en/products/detail/yageo/AC0603FR-075K1L/5896209; Composition: Thick Film; Device Package: 0603 (1608 Metric); Features: Automotive AEC-Q200, Moisture Resistant; Height - Seated (Max): 0.022" (0.55mm); LastUpdated: 7/25/2024 9:19:23 AM; Lifecycle Status: Active; Minimum Order: 1; Number of Terminations: 2; Operating Temperature: -55°C ~ 155°C; Package / Case: 0603 (1608 Metric); Packaging: CutTape; PartId: 17442; Part Status: Active; Price: 0.01; Ratings: AEC-Q200; Resistance: 5.1 kOhms; Series: AC; Size / Dimension: 0.063" L x 0.031" W (1.60mm x 0.80mm); Supplier 1: DigiKey; Supplier Part Number 1: YAG3621CT-ND; Supplier Device Package: 0603; Tolerance: ±1%
SW1 = SW Toggle
SW2 = SW Rotary: Rotary switch
VR1 = 3296X-1-105LF: Variable Resistor; Manufacturer_Name: Bourns; Datasheet Link: https://componentsearchengine.com/Datasheets/1/3296X-1-103.pdf; Height: 10mm; Manufacturer_Part_Number: 3296X-1-105LF; Mouser Part Number: 652-3296X-1-105LF; Mouser Price/Stock: https://www.mouser.co.uk/ProductDetail/Bourns/3296X-1-105LF?qs=sqUg%252BkV%252Bnc2wFy5RGGrKyA%3D%3D; Arrow Part Number: 3296X-1-105LF; Arrow Price/Stock: https://www.arrow.com/en/products/3296x-1-105lf/bourns?region=nac
X1-X7 = PBD-6: Manufacturer: Connfly; ValueManufacturerPartNumber: Connector, 6pin, 2.54mm, 500VAC, 3A; TypeConnector: Connector; VoltageMax: 500VAC; Pitch: 2.54mm; CurrentMax: 3A; Multichannel: 6pin; CommentText: "Разъем"; HelpURL: https://www.chipdip.ru/product/pbd-6; PartNumber: PBD-6